# EAGLE schematic roundtrip-demo (EAGLE 9.6.2)
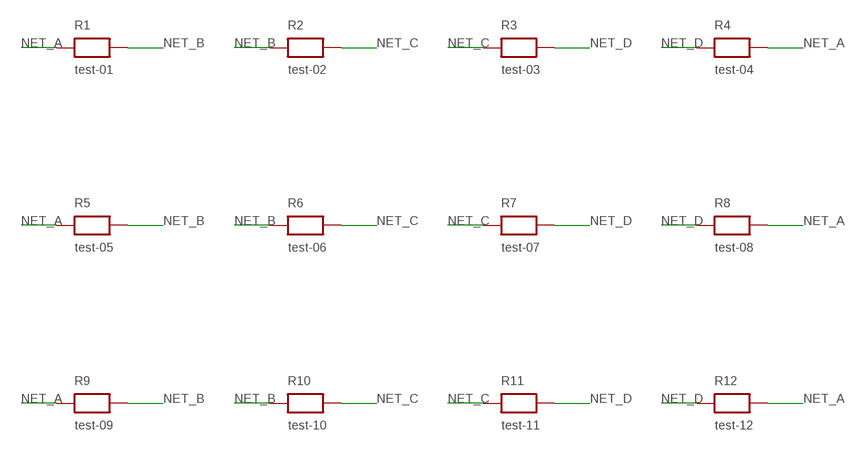
[diagram p0: schematic, sheet 1]

## Parts
R1  test-01  DEMO_THT  [DEMO_THT]
R2  test-02  DEMO_SMD  [DEMO_SMD]
R3  test-03  DEMO_SMD  [DEMO_SMD]
R4  test-04  DEMO_THT  [DEMO_THT]
R5  test-05  DEMO_SMD  [DEMO_SMD]
R6  test-06  DEMO_SMD  [DEMO_SMD]
R7  test-07  DEMO_THT  [DEMO_THT]
R8  test-08  DEMO_SMD  [DEMO_SMD]
R9  test-09  DEMO_SMD  [DEMO_SMD]
R10  test-10  DEMO_THT  [DEMO_THT]
R11  test-11  DEMO_SMD  [DEMO_SMD]
R12  test-12  DEMO_SMD  [DEMO_SMD]

## Nets
NET_A: R1.1(A) R4.2(B) R5.1(A) R8.2(B) R9.1(A) R12.2(B)
NET_B: R1.2(B) R2.1(A) R5.2(B) R6.1(A) R9.2(B) R10.1(A)
NET_C: R2.2(B) R3.1(A) R6.2(B) R7.1(A) R10.2(B) R11.1(A)
NET_D: R3.2(B) R4.1(A) R7.2(B) R8.1(A) R11.2(B) R12.1(A)

## Library data of the parts
R1 R4 R7 R10 = bridge-demo:DEMO_THT
R2 R3 R5 R6 R8 R9 R11 R12 = bridge-demo:DEMO_SMD